# Altium schematic sheet Imu_proj.SchDoc
size B
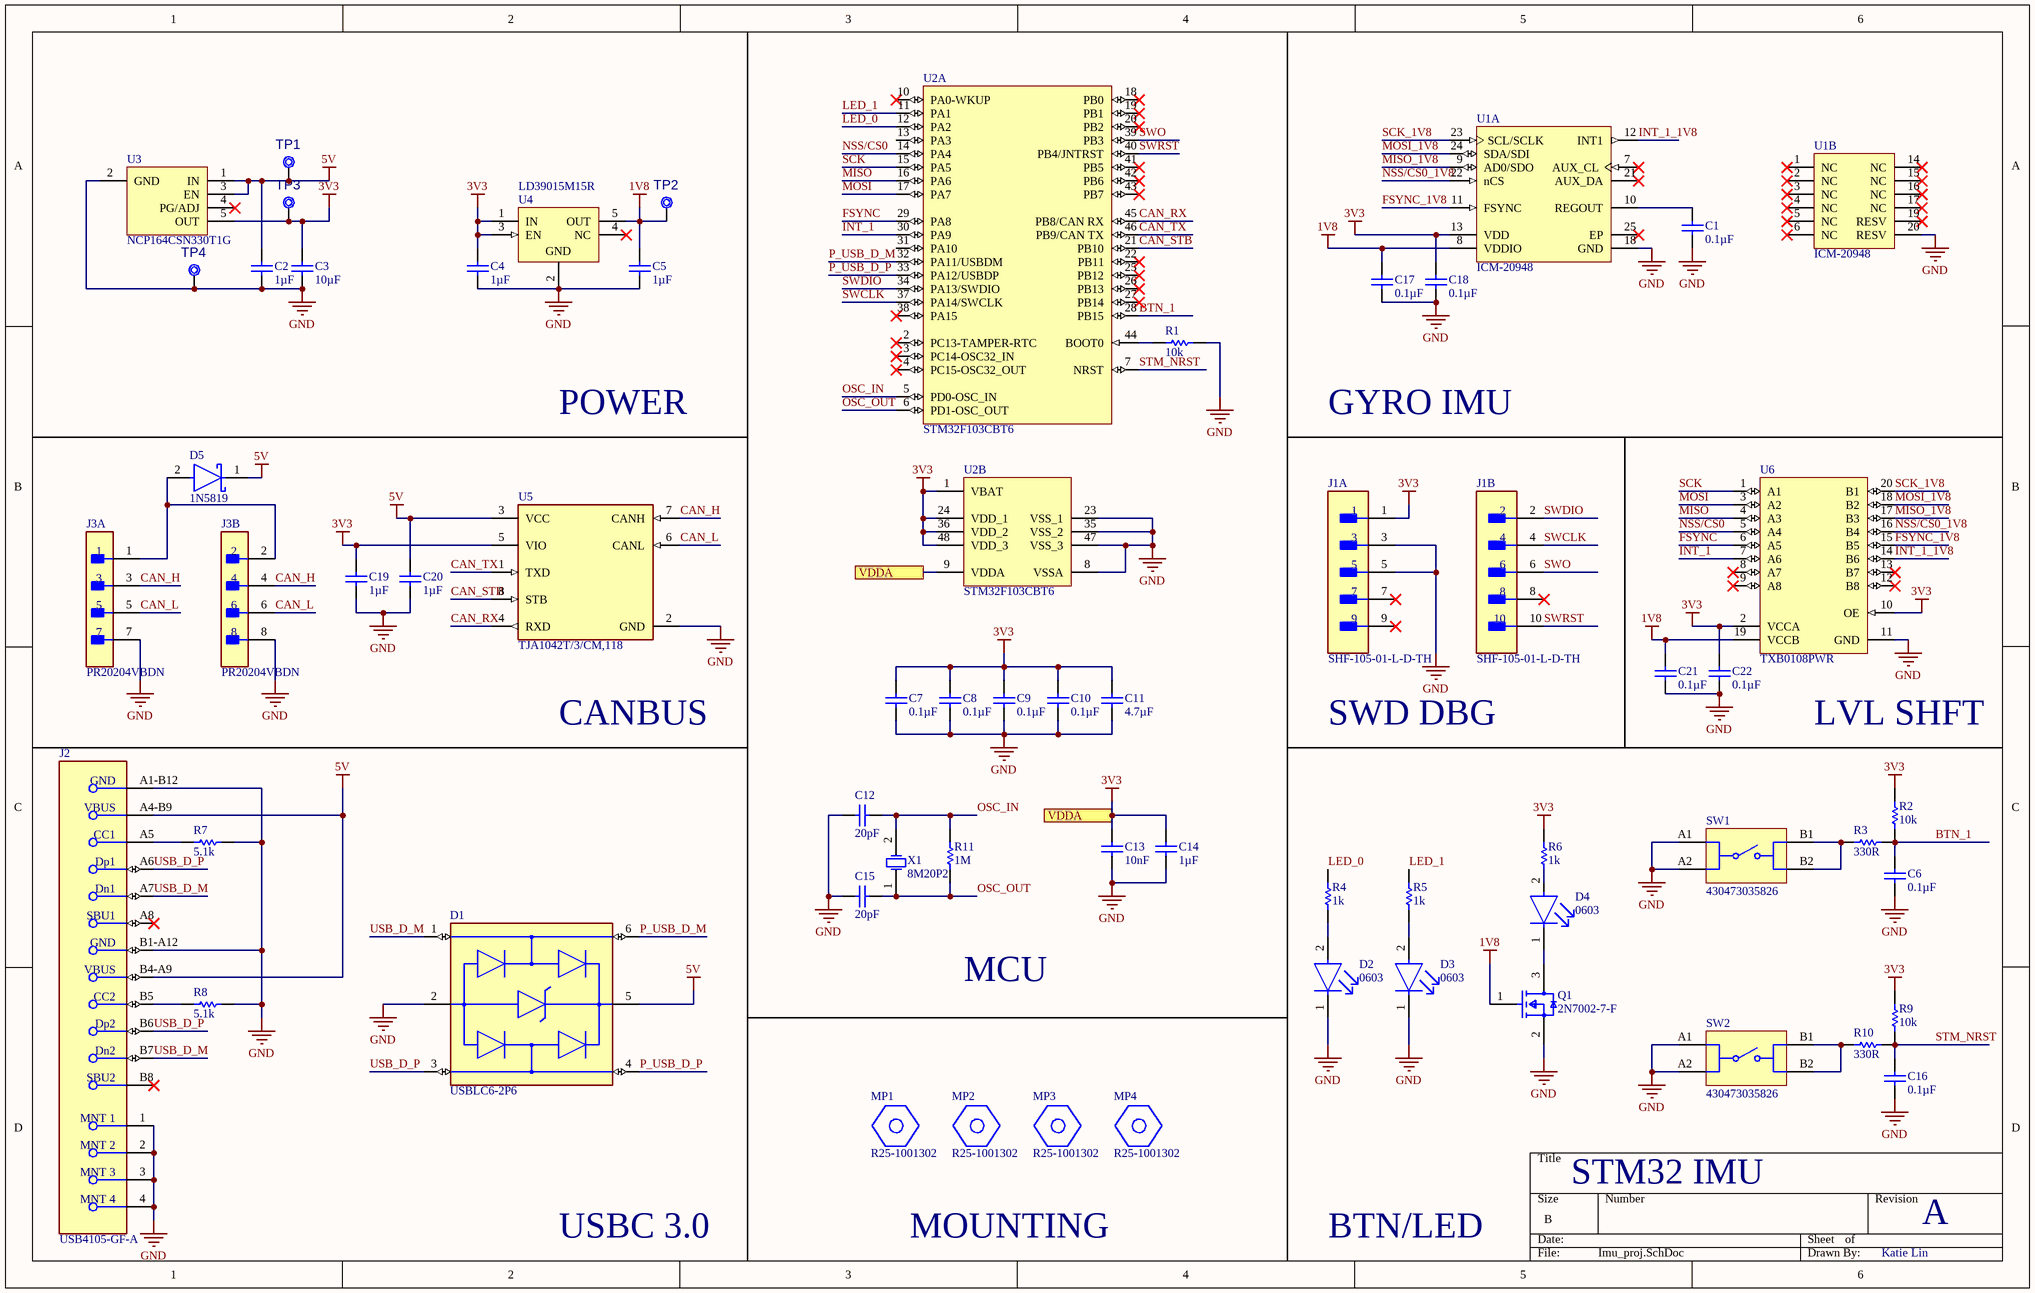
[diagram p0: Imu_proj.SchDoc]

## Parts
C1  0.1µF  [CAPC1608X87X35LL15T15]
C2  1µF  [CAPC1608X87X35LL15T15]
C3  10µF  [CAPC1608X87X35LL15T15]
C4  1µF  [CAPC1608X87X35LL15T15]
C5  1µF  [CAPC1608X87X35LL15T15]
C6  0.1µF  [CAPC1608X87X35LL15T15]
C7  0.1µF  [CAPC1608X87X35LL15T15]
C8  0.1µF  [CAPC1608X87X35LL15T15]
C9  0.1µF  [CAPC1608X87X35LL15T15]
C10  0.1µF  [CAPC1608X87X35LL15T15]
C11  4.7µF  [CAPC1608X87X35LL15T15]
C12  20pF  [CAPC1608X87X35LL15T15]
C13  10nF  [CAPC1608X87X35LL15T15]
C14  1µF  [CAPC1608X87X35LL15T15]
C15  20pF  [CAPC1608X87X35LL15T15]
C16  0.1µF  [CAPC1608X87X35LL15T15]
C17  0.1µF  [CAPC1608X87X35LL15T15]
C18  0.1µF  [CAPC1608X87X35LL15T15]
C19  1µF  [CAPC1608X87X35LL15T15]
C20  1µF  [CAPC1608X87X35LL15T15]
C21  0.1µF  [CAPC1608X87X35LL15T15]
C22  0.1µF  [CAPC1608X87X35LL15T15]
D1  USBLC6-2P6  [FP-SOT-666-MFG]
D2  0603  [FP-SML-LX0603SIW-TR-MFG]
D3  0603  [FP-SML-LX0603SIW-TR-MFG]
D4  0603  [FP-SML-LX0603SIW-TR-MFG]
D5  1N5819  [FP-SOD123-IPC_A]
J1  SHF-105-01-L-D-TH  [FP-SHF-105-01-L-D-TH-MFG]  (parts A,B of 2)
J2  USB4105-GF-A  [FP-USB4105-GF-A-MFG]
J3  PR20204VBDN  [FP-PR20204VBDN-MFG]  (parts A,B of 2)
MP1  R25-1001302  [FP-R25-1001302-MFG]
MP2  R25-1001302  [FP-R25-1001302-MFG]
MP3  R25-1001302  [FP-R25-1001302-MFG]
MP4  R25-1001302  [FP-R25-1001302-MFG]
Q1  2N7002-7-F  [FP-SOT23-MFG]
R1  10k  [RESC1608X55X25ML10T15]
R2  10k  [RESC1608X55X25ML10T15]
R3  330R  [RESC1608X55X25ML10T15]
R4  1k  [RESC1608X55X25ML10T15]
R5  1k  [RESC1608X55X25ML10T15]
R6  1k  [RESC1608X55X25ML10T15]
R7  5.1k  [RESC1608X55X25ML10T15]
R8  5.1k  [RESC1608X55X25ML10T15]
R9  10k  [RESC1608X55X25ML10T15]
R10  330R  [RESC1608X55X25ML10T15]
R11  1M  [RESC1608X55X25ML10T15]
SW1  430473035826  [430473035826]
SW2  430473035826  [430473035826]
TP1  Test Point No BOM  [tp_1mm_smd]  (value not drawn)  (no BOM)
TP2  Test Point No BOM  [tp_1mm_smd]  (value not drawn)  (no BOM)
TP3  Test Point No BOM  [tp_1mm_smd]  (value not drawn)  (no BOM)
TP4  Test Point No BOM  [tp_1mm_smd]  (value not drawn)  (no BOM)
U1  ICM-20948  [TDK-QFN-24_L]  (parts A,B of 2)
U2  STM32F103CBT6  [STM-LQFP48_L]  (parts A,B of 2)
U3  NCP164CSN330T1G  [ONSC-TSOP-5-483-02_V]
U4  LD39015M15R  [SOT23-5L_N]
U5  TJA1042T/3/CM,118  [FP-SOT96-1-IPC_A]
U6  TXB0108PWR  [PW0020A_L]
X1  8M20P2  [CTS-ATS-SM-XTAL-2]

## Ports
VDDA

## Nets
1V8: C5.2 C17.1 C21.1 Q1.1(G) TP2.1 U1.8(VDDIO) U4.5(OUT) U6.19(VCCB)
3V3: C3.2 C4.2 C7.2 C8.2 C9.2 C10.2 C11.2 C13.2 C14.2 C18.1 C19.2 C22.1 J1.1 R2.2 R6.2 R9.2 TP3.1 U1.13(VDD) U2.1(VBAT) U2.9(VDDA) U2.24(VDD_1) U2.36(VDD_2) U2.48(VDD_3) U3.5(OUT) U4.1(IN) U4.3(EN) U5.5(VIO) U6.2(VCCA) U6.10(OE) ; port VDDA
5V: C2.2 C20.2 D1.5(VBUS) D5.1 J2.A4-B9(VBUS) J2.B4-A9(VBUS) TP1.1 U3.1(IN) U3.3(EN) U5.3(VCC)
GND: C1.1 C2.1 C3.1 C4.1 C5.1 C6.1 C7.1 C8.1 C9.1 C10.1 C11.1 C12.2 C13.1 C14.1 C15.2 C16.1 C17.2 C18.2 C19.1 C20.1 C21.2 C22.2 D1.2(GND) D2.1(C) D3.1(C) J1.3 J1.5 J2.1(MNT_1) J2.2(MNT_2) J2.3(MNT_3) J2.4(MNT_4) J2.A1-B12(GND) J2.B1-A12(GND) J3.7 J3.8 Q1.2(S) R1.2 R7.1 R8.1 SW1.A1 SW1.A2 SW2.A1 SW2.A2 TP4.1 U1.18(GND) U1.20(RESV) U2.8(VSSA) U2.23(VSS_1) U2.35(VSS_2) U2.47(VSS_3) U3.2(GND) U4.2(GND) U5.2(GND) U6.11(GND)
BTN_1: C6.2 R2.1 R3.2 U2.28(PB15)
CAN_H: J3.3 J3.4 U5.7(CANH)
CAN_L: J3.5 J3.6 U5.6(CANL)
CAN_RX: U2.45(PB8/CAN_RX) U5.4(RXD)
CAN_STB: U2.21(PB10) U5.8(STB)
CAN_TX: U2.46(PB9/CAN_TX) U5.1(TXD)
FSYNC: U2.29(PA8) U6.6(A5)
FSYNC_1V8: U1.11(FSYNC) U6.15(B5)
INT_1: U2.30(PA9) U6.7(A6)
INT_1_1V8: U1.12(INT1) U6.14(B6)
LED_0: R4.2 U2.12(PA2)
LED_1: R5.2 U2.11(PA1)
MISO: U2.16(PA6) U6.4(A3)
MISO_1V8: U1.9(AD0/SDO) U6.17(B3)
MOSI: U2.17(PA7) U6.3(A2)
MOSI_1V8: U1.24(SDA/SDI) U6.18(B2)
NSS/CS0: U2.14(PA4) U6.5(A4)
NSS/CS0_1V8: U1.22(nCS) U6.16(B4)
OSC_IN: C12.1 R11.2 U2.5(PD0-OSC_IN) X1.2(X2)
OSC_OUT: C15.1 R11.1 U2.6(PD1-OSC_OUT) X1.1(X1)
P_USB_D_M: D1.6(I/O1) U2.32(PA11/USBDM)
P_USB_D_P: D1.4(I/O2) U2.33(PA12/USBDP)
SCK: U2.15(PA5) U6.1(A1)
SCK_1V8: U1.23(SCL/SCLK) U6.20(B1)
STM_NRST: C16.2 R9.1 R10.2 U2.7(NRST)
SWCLK: J1.4 U2.37(PA14/SWCLK)
SWDIO: J1.2 U2.34(PA13/SWDIO)
SWO: J1.6 U2.39(PB3)
SWRST: J1.10 U2.40(PB4/JNTRST)
USB_D_M: D1.1(I/O1) J2.A7(Dn1) J2.B7(Dn2)
USB_D_P: D1.3(I/O2) J2.A6(Dp1) J2.B6(Dp2)
NetC1_2: C1.2 U1.10(REGOUT)
NetD2_2: D2.2(A) R4.1
NetD3_2: D3.2(A) R5.1
NetD4_1: D4.1(C) Q1.3(D)
NetD4_2: D4.2(A) R6.1
NetD5_2: D5.2 J3.1 J3.2
NetJ2_A5: J2.A5(CC1) R7.2
NetJ2_B5: J2.B5(CC2) R8.2
NetR1_1: R1.1 U2.44(BOOT0)
NetR3_1: R3.1 SW1.B1 SW1.B2
NetR10_1: R10.1 SW2.B1 SW2.B2

Not connected (* = marked no-connect by the designer): J1 7* 8* 9*; J2 A8(SBU1)* B8(SBU2)*; U1 1(NC)* 2(NC)* 3(NC)* 4(NC)* 5(NC)* 6(NC)* 7(AUX_CL)* 14(NC)* 15(NC)* 16(NC)* 17(NC)* 19(RESV)* 21(AUX_DA)* 25(EP)*; U2 2(PC13-TAMPER-RTC)* 3(PC14-OSC32_IN)* 4(PC15-OSC32_OUT)* 10(PA0-WKUP)* 13(PA3) 18(PB0)* 19(PB1)* 20(PB2)* 22(PB11)* 25(PB12)* 26(PB13)* 27(PB14)* 31(PA10) 38(PA15)* 41(PB5)* 42(PB6)* 43(PB7)*; U3 4(PG/ADJ)*; U4 4(NC)*; U6 8(A7)* 9(A8)* 12(B8)* 13(B7)*

## Notes on the sheet
- POWER
- GYRO IMU
- CANBUS
- SWD DBG
- LVL SHFT
- MCU
- USBC 3.0
- MOUNTING
- BTN/LED
- STM32 IMU
- A
- Katie Lin

## Library data of the parts
C1-C22 = CMP-2006-03741-1: Part Number: C0603S102K5RACTU; Manufacturer: Kemet
D1 = CMP-12225-000058-1: TVS DIODE 5.25V 17V SOT666; Min Breakdown Voltage: 6V; Power Line Protection: Yes; Element Configuration: Dual; Test Current: 1mA; Working Voltage: 5V; Number of Channels: 2; Max Reverse Leakage Current: 150nA; Direction: Unidirectional; Peak Pulse Current: 5A; Number of Elements: 1; Capacitance: 3.5pF; Max Breakdown Voltage: 6V; Height: 0.6mm; Depth: 1.3mm; Contact Plating: Tin; Reverse Breakdown Voltage: 6V; REACH SVHC: No SVHC; Operating Supply Voltage: 5V; Width: 1.3mm; Max Operating Temperature: 125°C; Reverse Standoff Voltage: 5V; ESD Protection: Yes; Package Quantity: 1; Termination: SMD/SMT; Length: 1.7mm; Leakage Current: 150nA; Number of Bidirectional Channels: 2; Case/Package: SOT-666; Min Operating Temperature: -40°C; Number of Pins: 6; Clamping Voltage: 17V; Breakdown Voltage: 6V; Lead Free: Lead Free; Radiation Hardening: No; Packaging: Tape and Reel; Mount: Surface Mount; Polarity: Unidirectional
D2-D4 = CMP-57192-000009-1: LED RED DIFFUSED SMD; Test Current: 20mA; Forward Voltage: 2V; Approvals: UL; Dominant Wavelength: 636nm; Viewing Angle: 140°; Lens Color: White; Luminous Intensity: 60mcd; Power Rating: 50mW; Number of LEDs: 1; Color: Red; Forward Current: 20mA; Moisture Sensitivity Level: 2; Case Code (Imperial): 0603; Lead Free: Lead Free; Lens Transparency: Diffused; Case Code (Metric): 1608; Height: 0.6mm; Max Operating Temperature: 85°C; Width: 0.8mm; Lens Style: Diffused; Illumination Color: Red; Wavelength: 636nm; REACH SVHC: No SVHC; Package Quantity: 1; RoHS Compliant: Yes; Case/Package: 0603; Number of Pins: 2; Packaging: Tape and Reel; Length: 1.6mm; Mount: Surface Mount; Min Operating Temperature: -25°C
D5 = CMP-0303-00003-3: DIODE SCHOTTKY 40V 1A SOD123; Forward Voltage: 450mV; Capacitance: 110pF; Max Forward Surge Current (Ifsm): 25A; Peak Reverse Current: 50uA; Polarity: Standard; Element Configuration: Single; Max Power Dissipation: 450mW; Min Operating Temperature: -65°C; Package Quantity: 3000; Contact Plating: Tin; Weight: 0.000353oz; Max Repetitive Reverse Voltage (Vrrm): 40V; Max Reverse Voltage (DC): 40V; Height: 1.25mm; Average Rectified Current: 1A; Width: 1.7mm; Case/Package: SOD-123-2; Lead Free: Lead Free; Max Operating Temperature: 125°C; Current Rating: 1A; Termination: SMD/SMT; Forward Current: 1A; Radiation Hardening: No; Number of Pins: 2; Length: 2.85mm; Voltage Rating (DC): 40V; REACH SVHC: No SVHC; Peak Non-Repetitive Surge Current: 25A; Packaging: Tape and Reel; Output Current: 1A
J1 = CMP-02766-000059-1: CONN HEADER VERT 10POS 1.27MM; Manufacturer: Samtec; Standoff Height: 0.38mm; Conn Orientation: Vertical; Conn Gender: Male; Number Of Contacts: 10; Device Class L3: unset; Temperature Range Low: -55°C; Manufacturer Part Number: SHF-105-01-L-D-TH; Pitch: 1.27mm; RoHS: TRUE; Digikey Description: CONN HEADER VERT 10POS 1.27MM; ComponentLink2Description: Datasheet; Temperature: -55°C to +125°C; Lead Free: Yes; Device Class L1: Connectors; Height: 5.46mm; Category: Conn; Mouser Description: Conn Shrouded Header (4 Sides) HDR 10 POS 1.27mm Solder ST Thru-Hole Tube; Footprint Url: http://suddendocs.samtec.com/prints/shf-1xx-01-x-d-xx-xx-footprint.pdf; Number Of Rows: 2; Device Class L2: Headers and Wire Housings; Temperature Range High: +125°C; ComponentLink2URL: http://suddendocs.samtec.com/prints/shf-1xx-01-x-d-xx-xx-mkt.pdf; Automotive: No; Octopart: https://octopart.com/shf-105-01-l-d-th-samtec-17904677; Package: 0; Contact Material: Gold,Nickel
J2 = CMP-245163-000001-1: CONN RCPT USB2.0 TYPEC 5A; Manufacturer: GCT; Voltage Rating: 20V; Is Female: yes; Current Rating: 5/6.25/1.25/0.25A; Number Of Contacts: 16; Conn Orientation: Right Angle; Device Class L1: Connectors; Category: Conn; Lead Free: Yes; RoHS: TRUE; Temperature Range High: +85°C; Digikey Description: CONN RCPT USB2.0 TYPEC 5A; Device Class L3: unset; ComponentLink2Description: Datasheet; Manufacturer Part Number: USB4105-GF-A; Package: 0; Usb Standard: USB 2.0; Device Class L2: USB Connectors; Automotive: No; Temperature Range Low: -40°C; Height: 3.46mm; Temperature: -40°C to +85°C; Contact Material: Gold,Nickel; ComponentLink2URL: https://gct.co/files/drawings/usb4105.pdf; Octopart: https://octopart.com/usb4105-gf-a-gct-106627878
J3 = CMP-77940-000004-1: PIN HEADER, THR, DUAL ROW, .100"
MP1-MP4 = CMP-15845-000001-1: HEX STNDFF M2.5X0.45 BRASS 13MM; Gender: Female, Female; Thread Size: M2.5; Threaded/Unthreaded: Threaded; Plating: Nickel; Outside Diameter: 0.217inch; Color: Silver; Material: Brass; Series: R25-100; Length: 0.512inch; Package Quantity: 200
Q1 = CMP-2000-04929-2: MOSFET N-CH 60V 115MA SOT23-3; Turn-On Delay Time: 7ns; Turn-Off Delay Time: 11ns; Drain to Source Resistance: 7.5R; Rise Time: 3ns; Drain to Source Breakdown Voltage: 70V; Input Capacitance: 50pF; Number of Elements: 1; Power Dissipation: 540mW; Max Power Dissipation: 300mW; Fall Time: 5.6ns; Gate to Source Voltage (Vgs): 20V; Threshold Voltage: 2.5V; Element Configuration: Single; Termination: SMD/SMT; Weight: 0.000282oz; Radiation Hardening: No; Max Operating Temperature: 150°C; On-State Resistance: 7.5R; Mount: Surface Mount; Current Rating: 115mA; Contact Plating: Tin; Lead Free: Lead Free; Min Operating Temperature: -55°C; Number of Pins: 3; REACH SVHC: No SVHC; Drain to Source Voltage (Vdss): 60V; Width: 1.3mm; Package Quantity: 3000; Length: 2.9mm; Case/Package: SOT-23; Number of Channels: 1; Dual Supply Voltage: 60V; Packaging: Tape and Reel; Height: 1mm; Voltage Rating (DC): 60V; Nominal Vgs: 2.5V; Continuous Drain Current (ID): 115mA; Voltage: 60V; Rds On Max: 7.5R
R1-R11 = CMP-2000-04177-1: Part Number: RC0603FR-1020KL; Manufacturer: Yageo
SW1 SW2 = CMP-1455-00006-5: Switch Tactile Spst-no 0.05A 12V; Actuator Material: Liquid Crystal Polymer, Polymer; Switch Travel: 250µm; Throw Configuration: SPST; Illumination Type: Non-Illuminated; Insulation Resistance: 100MΩ; Current Rating: 50mA; Switch Function: Off-Mom; Mechanical Life: 500kcycles; Min Operating Temperature: -40°C; Packaging: Tape and Reel; Max Operating Temperature: 85°C; Mount: Surface Mount; Contact Plating: Silver; RoHS: Compliant; Voltage Rating: 12V; Height: 3.5mm
TP1-TP4 = CON1759: Test Point; Value: TP SMD D1; Description_: CON TP PAD PCB SMD D1; Dev Tools Status: Production; Owner: Cristian Papuc; Populated: YES; MCHP-ID: CON1759; Assembly Type: SMD; Revision: 1; Symbol: Test Point No BOM; Status: MCL Design; ComponentLink1Description: SVN Datasheet; ComponentLink2Description: Local Datasheet; ComponentLink3URL: C:\ALTIUM_WORK\00001_MCHP-CDB\Library\LibraryRefs\Test Point No BOM.SchLib; ComponentLink3Description: Open Symbol; ComponentLink4URL: C:\ALTIUM_WORK\00001_MCHP-CDB\Library\Footprints\TP_1mm_SMD.PcbLib; ComponentLink4Description: Open Footprint; ComponentLink5Description: Open Footprint 2; ComponentLink6Description: Open Footprint 3; ComponentLink7Description: Open Footprint 4; Type: Test Point No BOM; Category: Connector; Quantity Override: 1; Restricted Sourcing: No
U1 = CMP-2000-07532-1: World’s Lowest Power 9-Axis MEMS MotionTracking(TM) Device, 1.71 to 3.6 V, -40 to 85 degC, 24-Pin QFN, RoHS, Tape and Reel; Manufacturer: TDK; Package Description: 24-Pin Quad Flat No-lead Package, Body 3 x 3 mm, Pitch 0.4 mm; Datasheet Version: Rev. 1.3, 06/2017; Package Reference: QFN-24; Mounting Technology: SurfaceMount; Datasheet URL: https://www.invensense.com/wp-content/uploads/2016/06/DS-000189-ICM-20948-v1.3.pdf; Manufacturer URL: http://www.tdk.com/
U2 = CMP-0237-00250-3: ARM Cortex-M3 32-bit MCU, 128 KB Flash, 20 KB Internal RAM, 37 I/Os, 48-pin LQFP, -40 to 85 degC, Tray; Supply Voltage(Vcc) min (V): 2; Operating Frequency(F) (Processor speed) (MHz): 72; A/D Converter: 2x12-bit (10 Channel); FLASH Size (Prog) (kB): 128; Internal RAM Size (kB): 20; I/Os (High Current): 37; ComponentLink2Description: Datasheet; PackageReference: LQFP48; PartNumber: STM32F103CBT6; ComponentLink1Description: Manufacturer URL; DatasheetVersion: Rev. 16; PackageVersion: Rev. 6, 06/2013; Packing: Tray; ComponentLink1URL: http://www.st.com/web/en/home.html; Mounting Technology: Surface Mount; ComponentLink3URL: http://www.st.com/st-web-ui/static/active/en/resource/technical/document/datasheet/DM00058181.pdf; PackageDescription: 48-Pin Low Profile Quad Flat Package, 7 x 7 mm Body, 0.5 mm Pitch; Core: ARM Cortex-M3; ComponentLink3Description: Package Specification; ComponentLink2URL: http://www.st.com/st-web-ui/static/active/en/resource/technical/document/datasheet/CD00161566.pdf; Parameter 1: *
U3 = CMP-1063-00221-1: Bi-Directional Quad TVS Array, 5-Pin TSOP, Pb-Free, Tape and Reel; PartNumber: NUP4004M5T1G; Manufacturer: On Semiconductor; VRWM Max (V): 5; Number of Lines: 4; IR Max (uA): 1; Direction: Bidirectional; ComponentLink1URL: http://www.onsemi.com/; RoHS: Pb-Free; ComponentLink2URL: http://www.onsemi.cn/pub_link/Collateral/NUP4004M5-D.PDF; PackageVersion: Rev. K, 04/2013; PackageReference: TSOP-5-483-02; DatasheetVersion: Rev. 2; ComponentLink1Description: Manufacturer URL; ComponentLink3URL: http://www.onsemi.com/pub_link/Collateral/483.PDF; PackageDescription: 5-Pin Small Outline Package, Body 3 x 1.5 mm, Pitch 0.95 mm; Mounting Technology: Surface Mount; Packing: Tape and Reel; ComponentLink3Description: Package Specification; ComponentLink2Description: Datasheet
U4 = CMP-0244-00342-1: 150 mA Low Quiescent Current Low Noise Voltage Regulator, 1.5V, 5-Pin SOT-23, Tape and Reel; DatasheetVersion: 1/02/2009; ComponentLink1URL: http://www.st.com; PackageReference: SOT23-5L; ComponentLink2URL: http://www.st.com/internet/com/TECHNICAL_RESOURCES/TECHNICAL_LITERATURE/DATASHEET/CD00173477.pdf; PackageVersion: 1/01/2008; ComponentLink2Description: Datasheet; ComponentLink1Description: Manufacturer URL; PackageDescription: 5-Pin SOT-23 Package, 2.9 x 1.6 mm Body, 0.95 mm Pitch, 2.8 mm Lead Span
U5 = CMP-10098-000021-1: IC TRANSCEIVER HALF 1/1 8SO; Min Supply Voltage: 4.5V; Operating Supply Voltage: 5V; Data Rate: 1Mbps; Number of Transceivers: 1; Nominal Supply Current: 70mA; Max Supply Voltage: 5.5V; Mount: Surface Mount; Contact Plating: Gold; Max Operating Temperature: 150°C; Case/Package: SO; Lead Free: Lead Free; Max Supply Current: 70mA; Number of Pins: 8; Packaging: Tape and Reel; Radiation Hardening: No; Package Quantity: 2500; Min Operating Temperature: -40°C
U6 = CMP-2000-07337-1: TXB0108 8-Bit Bidirectional Voltage-Level Translator with Auto-Direction Sensing and / +/- 15-kV ESD Protection, 1.2 to 3.6 V, -40 to 85 degC, 20-Pin TSSOP (PW), Green (RoHS & no Sb/Br), Tape and Reel; Manufacturer: Texas Instruments; Propagation Delay (Max): 4ns; Logic Function: Translator,Bidirectional; Input Type: Logic; Package Version: 4040064-5/G, 02/2011; Voltage - Supply: 1.2V~3.6V,1.65V~5.5V; Data Rate: 100Mbps; Other Names: 296-21527-6; Number of Channels: 8; Differential - Input: Output:No/No; Number of Outputs/Channel: 1; Product Training Modules: VoltageLevelTranslation; Dynamic Catalog: TXBSeries; Package Reference: PW20; Package Description: 20-Pin Small Outline Package Integrated Circuit, Body 6.5 x 4.4 mm, Pitch 0.65 mm; Category: IntegratedCircuits(ICs); Datasheet URL: http://www.ti.com/general/docs/lit/getliterature.tsp?genericPartNumber=TXB0108&fileType=pdf; Package / Case: 20-TSSOP(0.173",4.40mmWidth); Family: Logic-Translators; Standard Package: 1; Series: -; Manufacturer URL: http://www.ti.com/; Number of Bits: 8; Package URL: http://www.ti.com/litv/pdf/mpds362; Output Type: Logic; Datasheet Version: Rev. F, 12/2014; Packaging: Digi-Reel®; Operating Temperature: -40°C~85°C; Supplier Device Package: 20-TSSOP; Mounting Technology: SurfaceMount
X1 = CMP-0585-00002-2: ATS-SM Series Quartz Crystal, 16 MHz, -20 to 70 degC, 11.1 x 4.83 x 4.3mm SMD, RoHS, Tape and Reel; PartNumber: ATS16ASM-1; Manufacturer: CTS Corporation; Shunt Capacitance (C0): 7.0 pF Max; Frequency: 16 MHz; Oscillation Mode: Fundamental or 3rd Overtone; Crystal Cut: AT-Cut; ESR Maximum: 40 Ohms; Drive Level (Type): 100 uW; PackageDescription: 2-Pin SMD, Body 11.1 x 4.83 mm, Pitch 8.5 mm; PackageReference: ATS-SM-XTAL-2; ComponentLink1URL: http://www.ctscorp.com/; RoHS: TRUE; ComponentLink1Description: Manufacturer URL; Operating Temperature: -20 to 70 degC; DatasheetVersion: Rev. K; ComponentLink2Description: Datasheet; Packing: Tape and Reel; ComponentLink2URL: http://www.ctscorp.com/components/Datasheets/008-0309-0.pdf; Mounting Technology: Surface Mount; ComponentLink3URL: http://www.ctscorp.com/components/Datasheets/008-0309-0.pdf; ComponentLink3Description: Package Specification